# Altium schematic sheet MTFC32GAPALBH.SchDoc
size A3; SheetNumber: 7; SheetTotal: 9
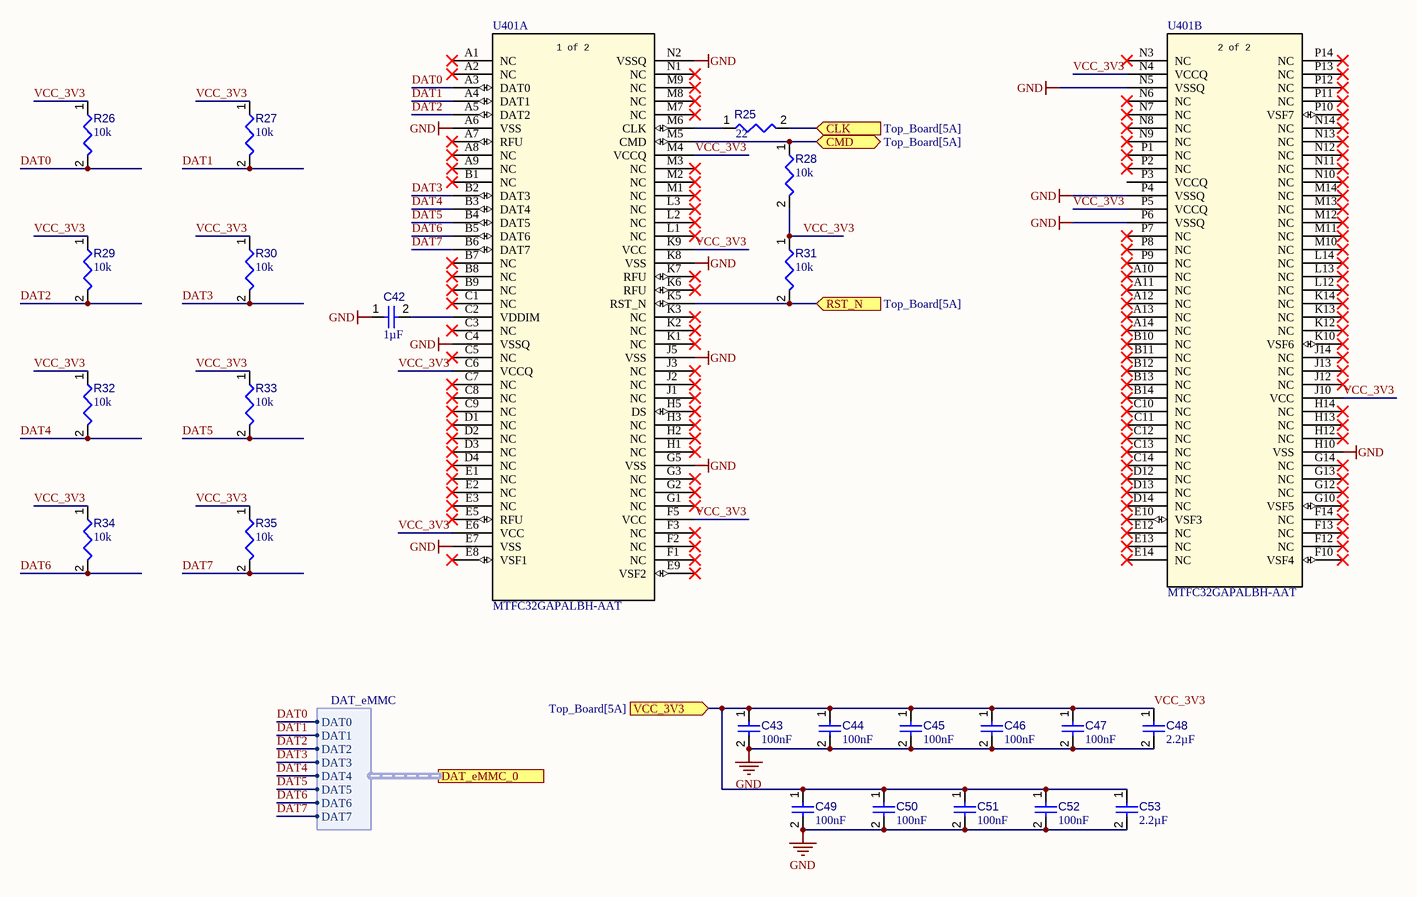
[diagram p0: MTFC32GAPALBH.SchDoc]

## Parts
C42  value 1µF  [CAPC2013X135X45NL10T25]  (hidden comment: Capacitor 1 uF +/- 10% 50 V 0805)
C43  value 100nF  [CAPC2013X95X50LL10T25]  (hidden comment: Capacitor 100 nF +/-10% 50 V 0805)
C44  value 100nF  [CAPC2013X95X50LL10T25]  (hidden comment: Capacitor 100 nF +/-10% 50 V 0805)
C45  value 100nF  [CAPC2013X95X50LL10T25]  (hidden comment: Capacitor 100 nF +/-10% 50 V 0805)
C46  value 100nF  [CAPC2013X95X50LL10T25]  (hidden comment: Capacitor 100 nF +/-10% 50 V 0805)
C47  value 100nF  [CAPC2013X95X50LL10T25]  (hidden comment: Capacitor 100 nF +/-10% 50 V 0805)
C48  value 2.2µF  [CAPC0402(1005)60_L]  (hidden comment: Capacitor 2,2µF +/-20% 10V 0402)
C49  value 100nF  [CAPC2013X95X50LL10T25]  (hidden comment: Capacitor 100 nF +/-10% 50 V 0805)
C50  value 100nF  [CAPC2013X95X50LL10T25]  (hidden comment: Capacitor 100 nF +/-10% 50 V 0805)
C51  value 100nF  [CAPC2013X95X50LL10T25]  (hidden comment: Capacitor 100 nF +/-10% 50 V 0805)
C52  value 100nF  [CAPC2013X95X50LL10T25]  (hidden comment: Capacitor 100 nF +/-10% 50 V 0805)
C53  value 2.2µF  [CAPC0402(1005)60_L]  (hidden comment: Capacitor 2,2µF +/-20% 10V 0402)
R25  value 22  [RESC0402(1005)_L]  (hidden comment: 22R2J)
R26  value 10k  [RESC2013X50X35ML15T15]  (hidden comment: Resistor 10k +/-1% 0805 125 mW)
R27  value 10k  [RESC2013X50X35ML15T15]  (hidden comment: Resistor 10k +/-1% 0805 125 mW)
R28  value 10k  [RESC2013X50X35ML15T15]  (hidden comment: Resistor 10k +/-1% 0805 125 mW)
R29  value 10k  [RESC2013X50X35ML15T15]  (hidden comment: Resistor 10k +/-1% 0805 125 mW)
R30  value 10k  [RESC2013X50X35ML15T15]  (hidden comment: Resistor 10k +/-1% 0805 125 mW)
R31  value 10k  [RESC2013X50X35ML15T15]  (hidden comment: Resistor 10k +/-1% 0805 125 mW)
R32  value 10k  [RESC2013X50X35ML15T15]  (hidden comment: Resistor 10k +/-1% 0805 125 mW)
R33  value 10k  [RESC2013X50X35ML15T15]  (hidden comment: Resistor 10k +/-1% 0805 125 mW)
R34  value 10k  [RESC2013X50X35ML15T15]  (hidden comment: Resistor 10k +/-1% 0805 125 mW)
R35  value 10k  [RESC2013X50X35ML15T15]  (hidden comment: Resistor 10k +/-1% 0805 125 mW)
U401  MTFC32GAPALBH-AAT  [TFBGA153_11P5X13_MRN]  (parts A,B of 2)

## Ports
CLK (in, see Top_Board[5A]), CMD (bidir, see Top_Board[5A]), DAT_eMMC_0 (harness DAT_eMMC), RST_N (in, see Top_Board[5A]), VCC_3V3 (in, see Top_Board[5A])

## Harnesses
DAT_eMMC: DAT0, DAT1, DAT2, DAT3, DAT5, DAT6, DAT7, DAT4

## Nets
GND: C42.1 C43.2 C44.2 C45.2 C46.2 C47.2 C48.2 C49.2 C50.2 C51.2 C52.2 C53.2 U401.A6(VSS) U401.C4(VSSQ) U401.E7(VSS) U401.G5(VSS) U401.H10(VSS) U401.J5(VSS) U401.K8(VSS) U401.N2(VSSQ) U401.N5(VSSQ) U401.P4(VSSQ) U401.P6(VSSQ)
CLK: R25.2 ; port CLK
CMD: R28.1 U401.M5(CMD) ; port CMD
DAT0: R26.2 U401.A3(DAT0) ; port DAT_eMMC_0.DAT0
DAT1: R27.2 U401.A4(DAT1) ; port DAT_eMMC_0.DAT1
DAT2: R29.2 U401.A5(DAT2) ; port DAT_eMMC_0.DAT2
DAT3: R30.2 U401.B2(DAT3) ; port DAT_eMMC_0.DAT3
DAT4: R32.2 U401.B3(DAT4) ; port DAT_eMMC_0.DAT4
DAT5: R33.2 U401.B4(DAT5) ; port DAT_eMMC_0.DAT5
DAT6: R34.2 U401.B5(DAT6) ; port DAT_eMMC_0.DAT6
DAT7: R35.2 U401.B6(DAT7) ; port DAT_eMMC_0.DAT7
RST_N: R31.2 U401.K5(RST_N) ; port RST_N
VCC_3V3: C43.1 C44.1 C45.1 C46.1 C47.1 C48.1 C49.1 C50.1 C51.1 C52.1 C53.1 R26.1 R27.1 R28.2 R29.1 R30.1 R31.1 R32.1 R33.1 R34.1 R35.1 U401.C6(VCCQ) U401.E6(VCC) U401.F5(VCC) U401.J10(VCC) U401.K9(VCC) U401.M4(VCCQ) U401.N4(VCCQ) U401.P5(VCCQ) ; port VCC_3V3
NetC42_2: C42.2 U401.C2(VDDIM)
NetR25_1: R25.1 U401.M6(CLK)

Not connected (* = marked no-connect by the designer): U401 A1(NC)* A2(NC)* A7(RFU)* A8(NC)* A9(NC)* A10(NC)* A11(NC)* A12(NC)* A13(NC)* A14(NC)* B1(NC)* B7(NC)* B8(NC)* B9(NC)* B10(NC)* B11(NC)* B12(NC)* B13(NC)* B14(NC)* C1(NC)* C3(NC)* C5(NC)* C7(NC)* C8(NC)* C9(NC)* C10(NC)* C11(NC)* C12(NC)* C13(NC)* C14(NC)* D1(NC)* D2(NC)* D3(NC)* D4(NC)* D12(NC)* D13(NC)* D14(NC)* E1(NC)* E2(NC)* E3(NC)* E5(RFU)* E8(VSF1)* E9(VSF2)* E10(VSF3)* E12(NC)* E13(NC)* E14(NC)* F1(NC)* F2(NC)* F3(NC)* F10(VSF4)* F12(NC)* F13(NC)* F14(NC)* G1(NC)* G2(NC)* G3(NC)* G10(VSF5)* G12(NC)* G13(NC)* G14(NC)* H1(NC)* H2(NC)* H3(NC)* H5(DS)* H12(NC)* H13(NC)* H14(NC)* J1(NC)* J2(NC)* J3(NC)* J12(NC)* J13(NC)* J14(NC)* K1(NC)* K2(NC)* K3(NC)* K6(RFU)* K7(RFU)* K10(VSF6)* K12(NC)* K13(NC)* K14(NC)* L1(NC)* L2(NC)* L3(NC)* L12(NC)* L13(NC)* L14(NC)* M1(NC)* M2(NC)* M3(NC)* M7(NC)* M8(NC)* M9(NC)* M10(NC)* M11(NC)* M12(NC)* M13(NC)* M14(NC)* N1(NC)* N3(NC)* N6(NC)* N7(NC)* N8(NC)* N9(NC)* N10(NC)* N11(NC)* N12(NC)* N13(NC)* N14(NC)* P1(NC)* P2(NC)* P3(VCCQ) P7(NC)* P8(NC)* P9(NC)* P10(VSF7)* P11(NC)* P12(NC)* P13(NC)* P14(NC)*

## Notes on the sheet
- (in symbol CMP-034-000000-1, part A) 1 of 2
- (in symbol CMP-034-000000-1, part B) 2 of 2

## Library data of the parts
C42 = CMP-001-00007-6: Chip Capacitor, 1 uF, +/- 10%, 50 V, 0805 (2012 Metric); Manufacturer: TDK; Manufacturer Part Number: C2012X7R1H105K125AB; Manufacturer: Murata; Manufacturer Part Number: GRM21BR71H105KA12L; Manufacturer: Kyocera / AVX; Manufacturer Part Number: 08055C105KAT2A; Capacitor Type: Ceramic; Voltage Rating: 50V; Min Operating Temperature: -55°C; RoHS Compliant: True; Mounting Technology: SM; Case/Package: 0805; Max Operating Temperature: 125°C; Tolerance: 10%; Pins: 2; Component Type: Capacitors
C43-C47 C49-C52 = CMP-001-00018-6: Chip Capacitor, 100 nF, +/- 10%, 50 V, 0805 (2012 Metric); Manufacturer: Yageo Group; Manufacturer Part Number: CC0805KRX7R9BB104; Manufacturer: Murata; Manufacturer Part Number: GRM21BR71H104KA01L; Capacitor Type: Ceramic; Voltage Rating: 50V; Pins: 2; Max Operating Temperature: 125°C; Min Operating Temperature: -55°C; Mounting Technology: SM; Case/Package: 0805; RoHS Compliant: True; Tolerance: 10%; Component Type: Capacitors
C48 C53 = CMP-001-00056-4: Chip Capacitor, 2,2µF +/-20%, 10V, 0402, Thickness 0.6 mm; Manufacturer: Samsung Electro-Mechanics; Manufacturer Part Number: CL05A225KP7NSB8; Manufacturer: Murata; Manufacturer Part Number: GRM155R61C225KE11D; Manufacturer: TDK; Manufacturer Part Number: C1005X5R1A225K; Manufacturer Part Number: GRM155R61A225KE95D; Manufacturer Part Number: GRM155R61C225KE44D; Manufacturer Part Number: GRT155R61E225KE13D; Tolerance: 10%; Mounting Technology: SMT; Max Operating Temperature: 85°C; Case/Package: 0402; Pins: 2; Min Operating Temperature: -55°C; Voltage Rating: 10V; Component Type: Capacitors
R25 = CMP-009-00082-2: 22R 0.063W 5% 0402 (1005 Metric)  SMD; Power: 63mW; Tolerance: 5%; Case/Package: 0402; Pins: 2; Mounting Technology: SMT
R26-R35 = CMP-009-00018-5: Chip Resistor, 10 KOhm, +/- 1%, 125 mW, -55 to 155 degC, 0805 (2012 Metric); Manufacturer: Yageo Group; Manufacturer Part Number: RC0805FR-0710KL; Manufacturer: Vishay; Manufacturer Part Number: CRCW080510K0FKEA; Manufacturer: Panasonic / Panasonic ECG; Manufacturer Part Number: ERJ-6ENF1002V; Power: 125mW; Voltage Rating: 150V; Tolerance: 1%; Pins: 2; Min Operating Temperature: -55°C; Case/Package: 0805; Max Operating Temperature: 155°C; RoHS Compliant: True; Mounting Technology: SM; Component Type: Resistors
U401 = CMP-034-000000-1: No Description Available; Manufacturer_Name: Micron; Copyright: Copyright (C) 2026 Ultra Librarian. All rights reserved.; Type: Type; Manufacturer_Part_Number: MTFC32GAPALBH-AAT; RefDes: RefDes; Design Item ID: MTFC32GAPALBH-AAT; Source: MTFC32GAPALBH-AAT.SchLib